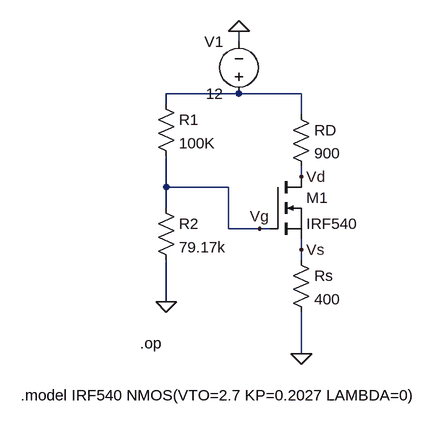
[diagram p0: schematic mosfet.asc]
mosfet.asc, the LTspice schematic file:
Version 4.1
SHEET 1 3716 680
WIRE 96 80 96 64
WIRE 96 160 -16 160
WIRE 192 160 96 160
WIRE -16 176 -16 160
WIRE 192 192 192 160
WIRE 192 288 192 272
WIRE -16 304 -16 256
WIRE 80 304 -16 304
WIRE -16 336 -16 304
WIRE 80 368 80 304
WIRE 128 368 80 368
WIRE 144 368 128 368
WIRE 192 400 192 384
WIRE 192 416 192 400
WIRE -16 480 -16 416
WIRE 192 560 192 496
FLAG -16 480 0
FLAG 192 560 0
FLAG 96 64 0
FLAG 192 288 Vd
FLAG 128 368 Vg
FLAG 192 400 Vs
SYMBOL voltage 96 176 R180
WINDOW 0 24 96 Left 2
WINDOW 3 24 16 Left 2
WINDOW 123 0 0 Left 0
WINDOW 39 0 0 Left 0
SYMATTR InstName V1
SYMATTR Value 12
SYMBOL res -32 160 R0
SYMATTR InstName R1
SYMATTR Value 100K
SYMBOL res 176 176 R0
SYMATTR InstName RD
SYMATTR Value 900
SYMBOL res -32 320 R0
SYMATTR InstName R2
SYMATTR Value 79.17k
SYMBOL nmos 144 288 R0
SYMATTR InstName M1
SYMATTR Value IRF540
SYMBOL res 176 400 R0
SYMATTR InstName Rs
SYMATTR Value 400
TEXT -56 544 Left 2 !.op
TEXT -240 624 Left 2 !.model IRF540 NMOS(VTO=2.7 KP=0.2027 LAMBDA=0)

The netlist it stands for:
* mosfet.asc
V1 N001 0 12
R1 N001 Vg 100K
RD N001 Vd 900
R2 Vg 0 79.17k
M1 Vd Vg Vs Vs IRF540
Rs Vs 0 400
.model NMOS NMOS
.model PMOS PMOS
.lib standard.mos
.op
.model IRF540 NMOS(VTO=2.7 KP=0.2027 LAMBDA=0)
.backanno
.end